# EasyEDA schematic NEONRED_Schematic_2026-10-19.json
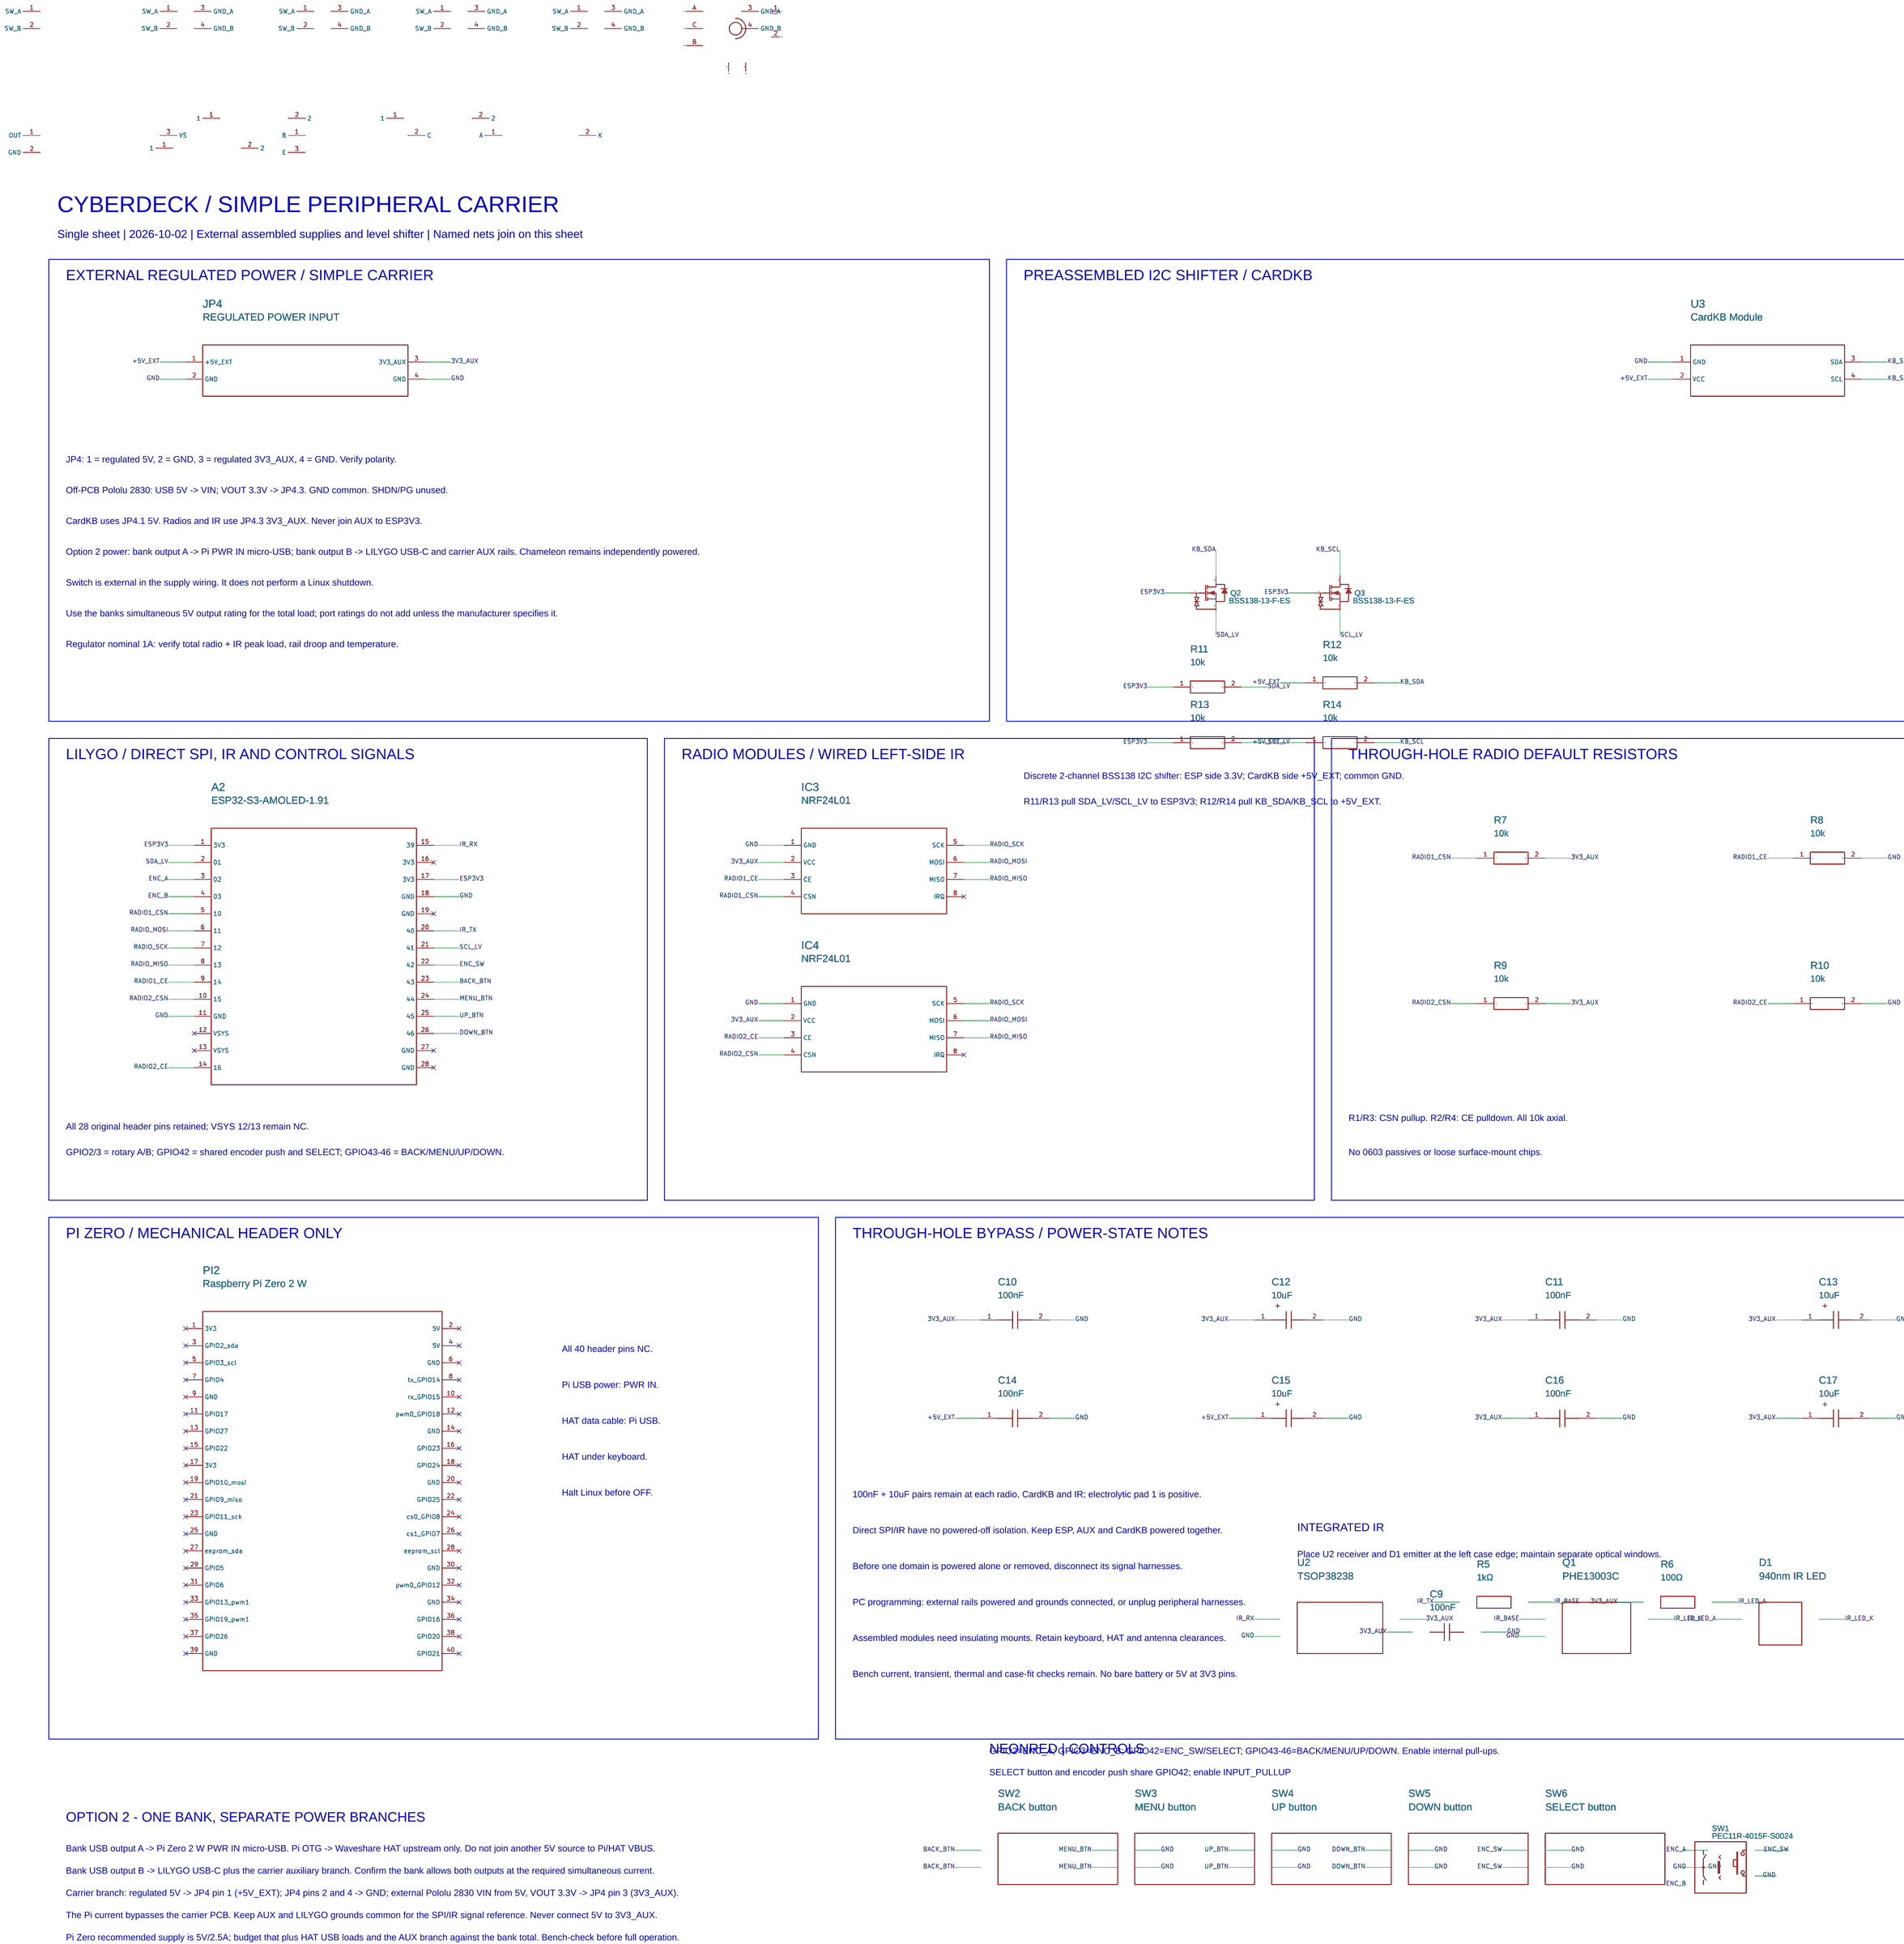
[diagram p0: schematic sheet]

## Parts
A2  ESP32-S3-AMOLED-1.91  [T-DISPLAY S3 AMOLED]
C9  100nF  [CAP-TH_L4.9-W3.7-P5.08-D0.5]
C10  100nF  [CERAMIC CAPACITOR 100NF 50V]
C11  100nF  [CERAMIC CAPACITOR 100NF 50V]
C12  10uF  [CAPACITOR 10UF TH FP]
C13  10uF  [CAPACITOR 10UF TH FP]
C14  100nF  [CERAMIC CAPACITOR 100NF 50V]
C15  10uF  [CAPACITOR 10UF TH FP]
C16  100nF  [CERAMIC CAPACITOR 100NF 50V]
C17  10uF  [CAPACITOR 10UF TH FP]
D1  940nm IR LED  [LED-5MM]
IC3  NRF24L01  [NRF24L01]
IC4  NRF24L01  [NRF24L01]
JP4  REGULATED POWER INPUT  [HDR-1X4T/2.54/10X2_J9]
PI2  Raspberry Pi Zero 2 W  [RASPBERRY-PIZERO-W]
Q1  PHE13003C  [TO-92-3_L4.9-W3.7-P2.54-L]
Q2  BSS138-13-F-ES  [SOT-23-3_L2.9-W1.3-P1.90-LS2.4-BR]
Q3  BSS138-13-F-ES  [SOT-23-3_L2.9-W1.3-P1.90-LS2.4-BR]
R5  1kΩ  [R_AXIAL-0.3]
R6  100Ω  [R_AXIAL-0.3]
R7  10k  [R_AXIAL-0.3]
R8  10k  [R_AXIAL-0.3]
R9  10k  [R_AXIAL-0.3]
R10  10k  [R_AXIAL-0.3]
R11  10k  [R_AXIAL-0.3]
R12  10k  [R_AXIAL-0.3]
R13  10k  [R_AXIAL-0.3]
R14  10k  [R_AXIAL-0.3]
SW1  PEC11R-4015F-S0024  [SW-TH_PEC11R-4XXXF-SXXXX]
SW2  BACK button  [SW-TH_4P-L6.0-W6.0-P4.50-LS6.5_TP13012613]
SW3  MENU button  [SW-TH_4P-L6.0-W6.0-P4.50-LS6.5_TP13012613]
SW4  UP button  [SW-TH_4P-L6.0-W6.0-P4.50-LS6.5_TP13012613]
SW5  DOWN button  [SW-TH_4P-L6.0-W6.0-P4.50-LS6.5_TP13012613]
SW6  SELECT button  [SW-TH_4P-L6.0-W6.0-P4.50-LS6.5_TP13012613]
U2  TSOP38238  [TSOP38238]
U3  CardKB Module  [NXW-04K]

## Library data of the parts
A2 = ESP32-S3-AMOLED-1.91: Manufacturer: Lilygo; Manufacturer Part: T-Display S3 AMOLED; Supplier: Lilygo; link: https://www.lilygo.cc/products/t-display-s3-amoled; Contributor: adamzh
C9 = 100nF: Manufacturer Part: 100nF ceramic THT; Footprint Status: DRAFT - VERIFY BEFORE FAB
C10 C11 C14 C16 = Ceramic capacitor 100nf 50V: Contributor: pampamapam
C12 C13 C15 C17 = Capacitor 10uF TH: Contributor: airyrahman
D1 = 940nm IR LED: Manufacturer Part: 940nm IR LED, 5 mm THT; Footprint Status: DRAFT - VERIFY BEFORE FAB
IC3 IC4 = NRF24L01: Contributor: JoachimHugo1
JP4 = M04: Contributor: SparkFun
PI2 = PI ZERO2 WDADAD: Contributor: greg_dickson
Q1 = 2N2222: Footprint Status: DRAFT - VERIFY BEFORE FAB; Supplier Part: C256388; Manufacturer: WeEn Semiconductors; Supplier: LCSC
Q2 Q3 = BSS138-13-F-ES: Contributor: lcsc; Supplier: LCSC; Supplier Part: C5224274; Manufacturer: ElecSuper(静芯); JLCPCB Part Class: Extended Part
R5 = 1kΩ: Manufacturer Part: 1k axial THT; Footprint Status: DRAFT - VERIFY BEFORE FAB
R6 = 100Ω: Manufacturer Part: 100Ω axial THT; Footprint Status: DRAFT - VERIFY BEFORE FAB
R7-R14 = Resistor
SW1 = PEC11R-4015F-S0024: Contributor: LCSC; Supplier: LCSC; Supplier Part: C143789; Manufacturer: BOURNS; JLCPCB Part Class: Extended Part
SW2 = BACK button: Manufacturer Part: 6x6mm THT tactile switch, NO; Footprint Status: DRAFT - VERIFY BEFORE FAB
SW3 = MENU button: Manufacturer Part: 6x6mm THT tactile switch, NO; Footprint Status: DRAFT - VERIFY BEFORE FAB
SW4 = UP button: Manufacturer Part: 6x6mm THT tactile switch, NO; Footprint Status: DRAFT - VERIFY BEFORE FAB
SW5 = DOWN button: Manufacturer Part: 6x6mm THT tactile switch, NO; Footprint Status: DRAFT - VERIFY BEFORE FAB
SW6 = SELECT button: Manufacturer Part: 6x6mm THT tactile switch, NO; Footprint Status: DRAFT - VERIFY BEFORE FAB
U2 = TSOP38238: Footprint Status: DRAFT - VERIFY BEFORE FAB
U3 = CardKB Module: Manufacturer: M5Stack; Manufacturer Part: CardKB; Supplier Part: NXW-03K; Contributor: cane.cave

## Nets
3V3_AUX: C9.1 C10.1 C11.1 C12.1 C13.1 C16.1 C17.1 IC3.2(VCC) IC4.2(VCC) JP4.3(3V3_AUX) R6.1 R7.2 R9.2 U2.3(VS)
+5V_EXT: C14.1 C15.1 JP4.1(+5V_EXT) R12.1 R14.1 U3.2(VCC)
GND: A2.11(GND) A2.18(GND) C9.2 C10.2 C11.2 C12.2 C13.2 C14.2 C15.2 C16.2 C17.2 IC3.1(GND) IC4.1(GND) JP4.2(GND) JP4.4(GND) Q1.3(E) R8.2 R10.2 SW1.2 SW1.C SW2.3(GND_A) SW2.4(GND_B) SW3.3(GND_A) SW3.4(GND_B) SW4.3(GND_A) SW4.4(GND_B) SW5.3(GND_A) SW5.4(GND_B) SW6.4(GND_B) U2.2(GND) U3.1(GND)
BACK_BTN: A2.23(43) SW2.1(SW_A) SW2.2(SW_B)
DOWN_BTN: A2.26(46) SW5.1(SW_A) SW5.2(SW_B)
ENC_A: A2.3(02) SW1.A SW6.3(GND_A)
ENC_B: A2.4(03) SW1.B
ENC_SW: A2.22(42) SW1.1 SW6.1(SW_A) SW6.2(SW_B)
ESP3V3: A2.1(3V3) A2.17(3V3) Q2.1(G) Q3.1(G) R11.1 R13.1
IR_BASE: Q1.1(B) R5.2
IR_LED_A: D1.1(A) R6.2
IR_LED_K: D1.2(K) Q1.2(C)
IR_RX: A2.15(39) U2.1(OUT)
IR_TX: A2.20(40) R5.1
KB_SCL: Q3.3(D) R14.2 U3.4(SCL)
KB_SDA: Q2.3(D) R12.2 U3.3(SDA)
MENU_BTN: A2.24(44) SW3.1(SW_A) SW3.2(SW_B)
RADIO1_CE: A2.9(14) IC3.3(CE) R8.1
RADIO1_CSN: A2.5(10) IC3.4(CSN) R7.1
RADIO2_CE: A2.14(16) IC4.3(CE) R10.1
RADIO2_CSN: A2.10(15) IC4.4(CSN) R9.1
RADIO_MISO: A2.8(13) IC3.7(MISO) IC4.7(MISO)
RADIO_MOSI: A2.6(11) IC3.6(MOSI) IC4.6(MOSI)
RADIO_SCK: A2.7(12) IC3.5(SCK) IC4.5(SCK)
SCL_LV: A2.21(41) Q3.2(S) R13.2
SDA_LV: A2.2(01) Q2.2(S) R11.2
UP_BTN: A2.25(45) SW4.1(SW_A) SW4.2(SW_B)

Not connected (* = marked no-connect by the designer): A2 12(VSYS)* 13(VSYS)* 16(3V3)* 19(GND)* 27(GND)* 28(GND)*; IC3 8(IRQ)*; IC4 8(IRQ)*; PI2 1(3V3)* 2(5V)* 3(GPIO2 sda)* 4(5V)* 5(GPIO3 scl)* 6(GND)* 7(GPIO4)* 8(tx GPIO14)* 9(GND)* 10(rx GPIO15)* 11(GPIO17)* 12(pwm0 GPIO18)* 13(GPIO27)* 14(GND)* 15(GPIO22)* 16(GPIO23)* 17(3V3)* 18(GPIO24)* 19(GPIO10 mosi)* 20(GND)* 21(GPIO9 miso)* 22(GPIO25)* 23(GPIO11 sck)* 24(cs0 GPIO8)* 25(GND)* 26(cs1 GPIO7)* 27(eeprom sda)* 28(eeprom scl)* 29(GPIO5)* 30(GND)* 31(GPIO6)* 32(pwm0 GPIO12)* 33(GPIO13 pwm1)* 34(GND)* 35(GPIO19 pwm1)* 36(GPIO16)* 37(GPIO26)* 38(GPIO20)* 39(GND)* 40(GPIO21)*; SW1 MT1 MT2

## Notes on the sheet
- CYBERDECK / SIMPLE PERIPHERAL CARRIER
- Single sheet | 2026-10-02 | External assembled supplies and level shifter | Named nets join on this sheet
- EXTERNAL REGULATED POWER / SIMPLE CARRIER
- PREASSEMBLED I2C SHIFTER / CARDKB
- JP4: 1 = regulated 5V, 2 = GND, 3 = regulated 3V3_AUX, 4 = GND. Verify polarity.
- Off-PCB Pololu 2830: USB 5V -> VIN; VOUT 3.3V -> JP4.3. GND common. SHDN/PG unused.
- CardKB uses JP4.1 5V. Radios and IR use JP4.3 3V3_AUX. Never join AUX to ESP3V3.
- Option 2 power: bank output A -> Pi PWR IN micro-USB; bank output B -> LILYGO USB-C and carrier AUX rails. Chameleon remains independently powered.
- Switch is external in the supply wiring. It does not perform a Linux shutdown.
- Use the banks simultaneous 5V output rating for the total load; port ratings do not add unless the manufacturer specifies it.
- Regulator nominal 1A: verify total radio + IR peak load, rail droop and temperature.
- LILYGO / DIRECT SPI, IR AND CONTROL SIGNALS
- RADIO MODULES / WIRED LEFT-SIDE IR
- THROUGH-HOLE RADIO DEFAULT RESISTORS
- Discrete 2-channel BSS138 I2C shifter: ESP side 3.3V; CardKB side +5V_EXT; common GND.
- R11/R13 pull SDA_LV/SCL_LV to ESP3V3; R12/R14 pull KB_SDA/KB_SCL to +5V_EXT.
- R1/R3: CSN pullup. R2/R4: CE pulldown. All 10k axial.
- All 28 original header pins retained; VSYS 12/13 remain NC.
- GPIO2/3 = rotary A/B; GPIO42 = shared encoder push and SELECT; GPIO43-46 = BACK/MENU/UP/DOWN.
- No 0603 passives or loose surface-mount chips.
- PI ZERO / MECHANICAL HEADER ONLY
- THROUGH-HOLE BYPASS / POWER-STATE NOTES
- All 40 header pins NC.
- Pi USB power: PWR IN.
- HAT data cable: Pi USB.
- HAT under keyboard.
- Halt Linux before OFF.
- 100nF + 10uF pairs remain at each radio, CardKB and IR; electrolytic pad 1 is positive.
- Direct SPI/IR have no powered-off isolation. Keep ESP, AUX and CardKB powered together.
- INTEGRATED IR
- Place U2 receiver and D1 emitter at the left case edge; maintain separate optical windows.
- Before one domain is powered alone or removed, disconnect its signal harnesses.
- PC programming: external rails powered and grounds connected, or unplug peripheral harnesses.
- Assembled modules need insulating mounts. Retain keyboard, HAT and antenna clearances.
- Bench current, transient, thermal and case-fit checks remain. No bare battery or 5V at 3V3 pins.
- GPIO2=ENC_A; GPIO3=ENC_B; GPIO42=ENC_SW/SELECT; GPIO43-46=BACK/MENU/UP/DOWN. Enable internal pull-ups.
- NEONRED | CONTROLS
- SELECT button and encoder push share GPIO42; enable INPUT_PULLUP
- OPTION 2 - ONE BANK, SEPARATE POWER BRANCHES
- Bank USB output A -> Pi Zero 2 W PWR IN micro-USB. Pi OTG -> Waveshare HAT upstream only. Do not join another 5V source to Pi/HAT VBUS.
- Bank USB output B -> LILYGO USB-C plus the carrier auxiliary branch. Confirm the bank allows both outputs at the required simultaneous current.
- Carrier branch: regulated 5V -> JP4 pin 1 (+5V_EXT); JP4 pins 2 and 4 -> GND; external Pololu 2830 VIN from 5V, VOUT 3.3V -> JP4 pin 3 (3V3_AUX).
- The Pi current bypasses the carrier PCB. Keep AUX and LILYGO grounds common for the SPI/IR signal reference. Never connect 5V to 3V3_AUX.
- Pi Zero recommended supply is 5V/2.5A; budget that plus HAT USB loads and the AUX branch against the bank total. Bench-check before full operation.
